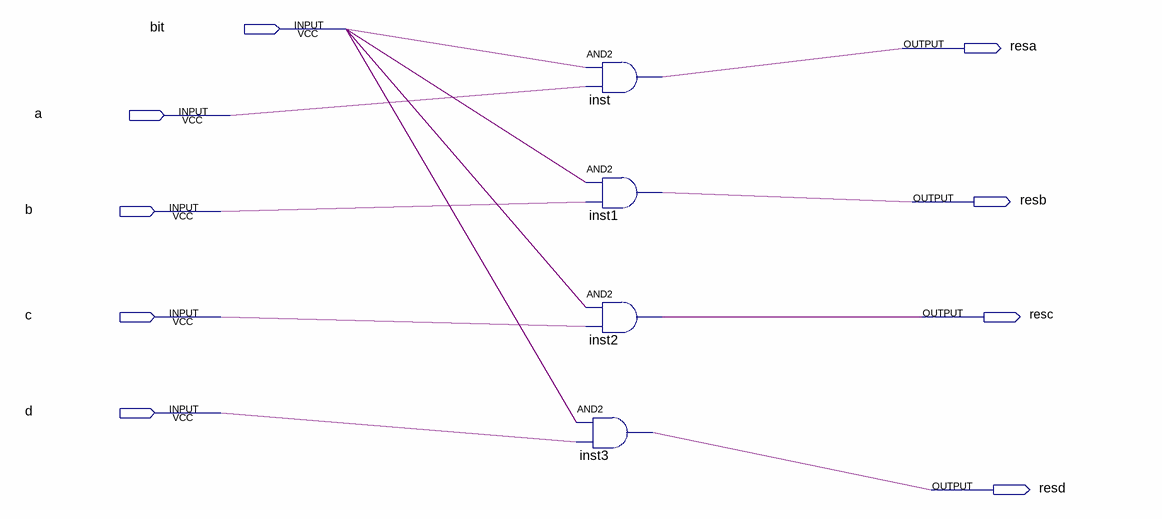
[diagram p0: schematic sheet]
// Quartus schematic fullMult.bdf as structural Verilog: 4 symbols, 9 pins
module fullMult (
  input  \bit ,
  input  a,
  input  b,
  input  c,
  input  d,
  output resa,
  output resb,
  output resc,
  output resd
);

  and inst (resa, \bit , a);
  and inst1 (resb, \bit , b);
  and inst2 (resc, \bit , c);
  and inst3 (resd, \bit , d);
endmodule
